# Altium schematic sheet IR Sensor.SchDoc: PCB IR SENSOR
size A4; Author: VietHoang; DrawnBy: VietHoang; SheetNumber: 1; SheetTotal: 1; Origin: Eagle
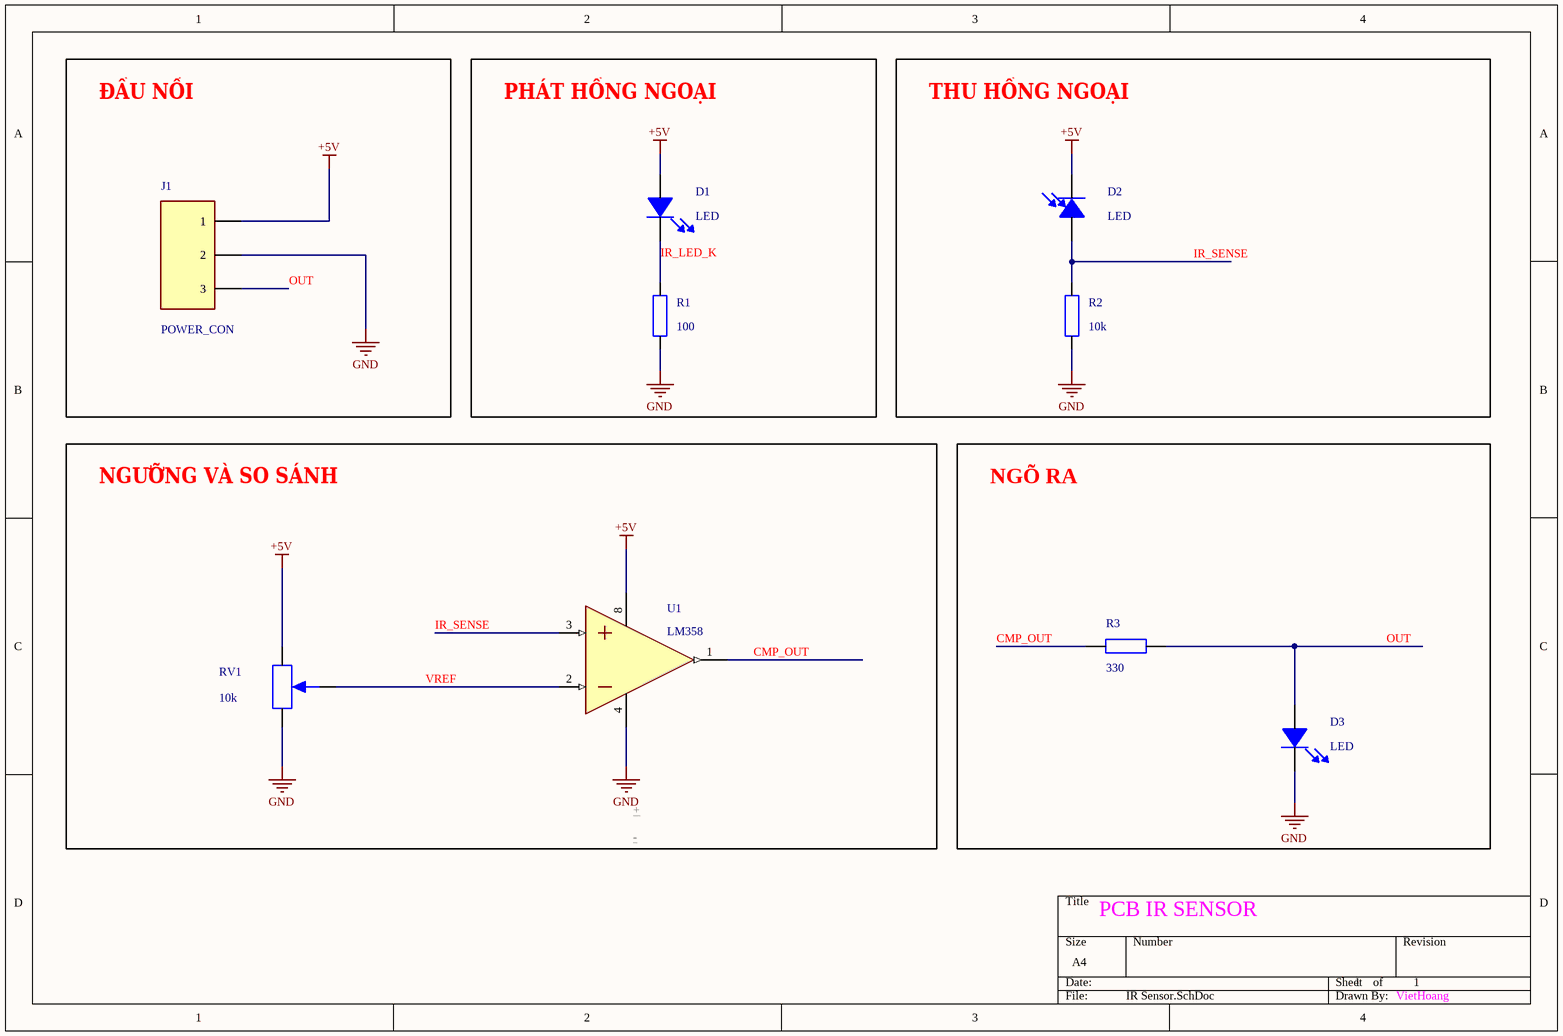
[diagram p0: IR Sensor.SchDoc]

## Parts
D1  LED  [D1]
D2  LED  [D2]
D3  LED  [D3]
J1  POWER_CON  [J1]
R1  100  [R1]
R2  10k  [R2]
R3  330  [R3]
RV1  10k  [RV1]
U1  LM358  [U1]

## Blocks framed on the sheet
ĐẦU NỐI: J1
PHÁT HỒNG NGOẠI: D1 R1
THU HỒNG NGOẠI: D2 R2
NGƯỠNG VÀ SO SÁNH: RV1 U1
NGÕ RA: D3 R3

## Nets
+5V: D1.2 D2.1 J1.1 RV1.1 U1.8(V+)
GND: D3.1 J1.2 R1.2 R2.2 RV1.3 U1.4(V-)
CMP_OUT: R3.2 U1.1
IR_LED_K: D1.1 R1.1
IR_SENSE: D2.2 R2.1 U1.3(IN+)
OUT: D3.2 J1.3 R3.1
VREF: RV1.2 U1.2(IN-)

## Notes on the sheet
- 1

## Library data of the parts
D1 = D1: GateName_1: G$1; SymbolName_1: D1; LibraryName: IR_SENSOR; DeviceSetName: D1
D2 = D2: GateName_1: G$1; SymbolName_1: D2; LibraryName: IR_SENSOR; DeviceSetName: D2
D3 = D3: GateName_1: G$1; SymbolName_1: D3; LibraryName: IR_SENSOR; DeviceSetName: D3
J1 = J1: GateName_1: G$1; SymbolName_1: J1; LibraryName: IR_SENSOR; DeviceSetName: J1
R1 = R1: GateName_1: G$1; SymbolName_1: R1; LibraryName: IR_SENSOR; DeviceSetName: R1
R2 = R2: GateName_1: G$1; SymbolName_1: R2; LibraryName: IR_SENSOR; DeviceSetName: R2
R3 = R3: GateName_1: G$1; SymbolName_1: R3; LibraryName: IR_SENSOR; DeviceSetName: R3
RV1 = RV1: GateName_1: G$1; SymbolName_1: RV1; LibraryName: IR_SENSOR; DeviceSetName: RV1
U1 = U1: GateName_1: G$1; SymbolName_1: U1; LibraryName: IR_SENSOR; DeviceSetName: U1; -: -; +: +